# Altium schematic sheet FG23_diff_PA_match_SCH_RF_Power.SchDoc
size 420 x 297 mm
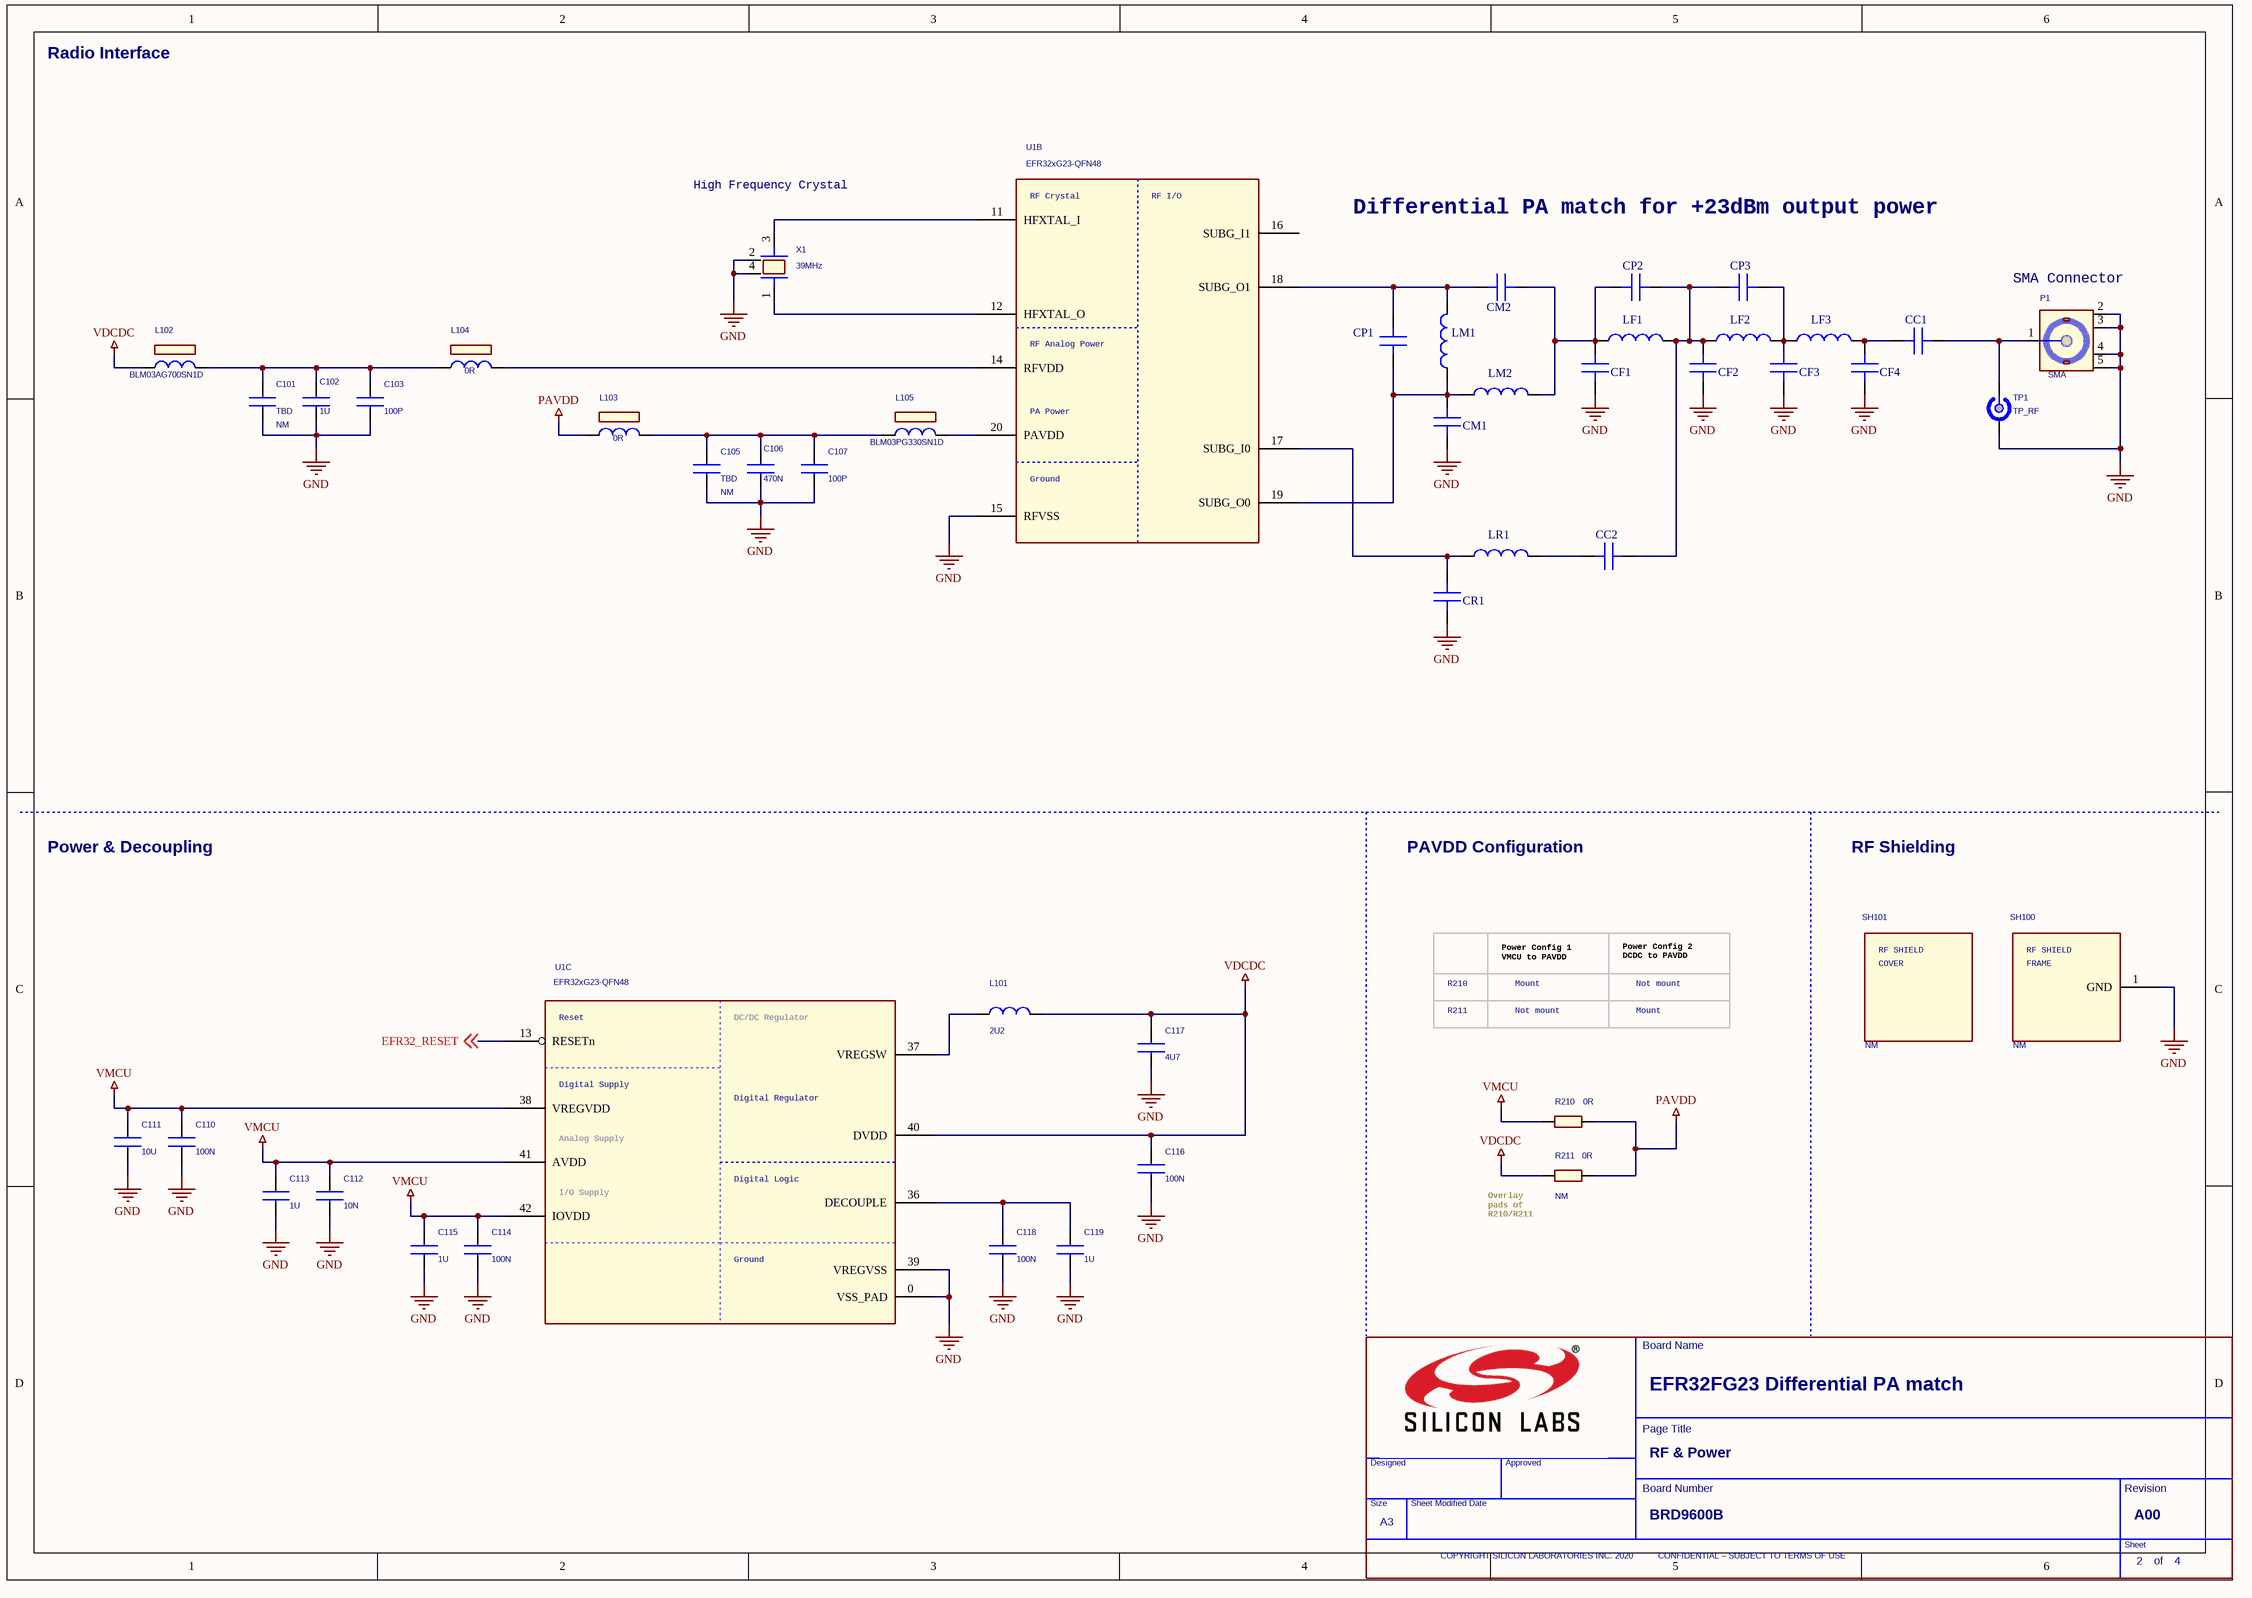
[diagram p0: FG23_diff_PA_match_SCH_RF_Power.SchDoc]

## Parts
*  Doc: BRD9600B  RevCode: A00  Page Title: RF & Power  Page Size: A3  Page Number: 2  Page Count: 4  Title: EFR32FG23 Differential PA match  (hidden comment: TitleBlock_SiliconLabs_A3)  (graphical)
C101  TBD  Not Mounted: NM  [C0201_L]
C102  1U  [C0402_L]
C103  100P  [C0201_L]
C105  TBD  Not Mounted: NM  [C0201_L]
C106  470N  [C0402_L]
C107  100P  [C0201_L]
C110  100N  [C0201_L]
C111  10U  [C0603_L]
C112  10N  [C0201_L]
C113  1U  [C0402_L]
C114  100N  [C0201_L]
C115  1U  [C0402_L]
C116  100N  [C0201_L]
C117  4U7  [C0603_L]
C118  100N  [C0201_L]
C119  1U  [C0402_L]
CC1  (no value)  [C0201_GM]
CC2  (no value)  [C0201_GM]
CF1  (no value)  [C0201_GM]
CF2  (no value)  [C0201_GM]
CF3  (no value)  [C0201_GM]
CF4  (no value)  [C0201_GM]
CM1  (no value)  [C0201_GM]
CM2  (no value)  [C0201_GM]
CP1  (no value)  [C0201_GM]
CP2  (no value)  [C0201_GM]
CP3  (no value)  [C0201_GM]
CR1  (no value)  [C0201_GM]
L101  2U2  [COIL_1008_L]
L102  BLM03AG700SN1D  [COIL_MUR_BLM03_0201]
L103  0R  [COIL_MUR_BLM03_0201]
L104  0R  [COIL_MUR_BLM03_0201]
L105  BLM03PG330SN1D  [COIL_MUR_BLM03_0201]
LF1  LQP03HQ3N6B02  [COIL_0201_GM]  (value not drawn)
LF2  LQP03HQ3N6B02  [COIL_0201_GM]  (value not drawn)
LF3  LQP03HQ3N6B02  [COIL_0201_GM]  (value not drawn)
LM1  LQP03HQ3N6B02  [COIL_0201_GM]  (value not drawn)
LM2  LQP03HQ3N6B02  [COIL_0201_GM]  (value not drawn)
LR1  LQP03HQ3N6B02  [COIL_0201_GM]  (value not drawn)
P1  SMA  [TE_SMA_1814832_TH_VER]
R210  0R  [R0402_L]
R211  0R  Not Mounted: NM  [R0402_L]
SH100  Not Mounted: NM  [Shield_21x21mm]  (hidden comment: RF_SHIELD_FRAME_36103205S)
SH101  Not Mounted: NM  (hidden comment: RF_SHIELD_COVER_36003200S)
TP1  TP_RF  [TP_INGUN_50OHM_PARTIAL]
U1  EFR32xG23-QFN48  [QFN48_M040_6.0X6.0_EP_SL]  (parts B,C of 3)
X1  39MHz  [X_SSS_DSX211SH_2.05X1.65-4]

## Nets
GND: C101.2 C102.2 C103.2 C105.2 C106.2 C107.2 C110.2 C111.2 C112.2 C113.2 C114.2 C115.2 C116.2 C117.2 C118.2 C119.2 CF1.1 CF2.1 CF3.1 CF4.1 CM1.1 CR1.1 P1.2(GND1) P1.3(GND2) P1.4(GND3) P1.5(GND4) SH100.1(GND) TP1.2(GND) U1.0(VSS_PAD) U1.15(RFVSS) U1.39(VREGVSS) X1.2 X1.4
PAVDD: L103.1 R210.1 R211.2
VDCDC: C116.1 C117.1 L101.2 L102.1 R211.1 U1.40(DVDD)
VMCU: C110.1 C111.1 C112.1 C113.1 C114.1 C115.1 R210.2 U1.38(VREGVDD) U1.41(AVDD) U1.42(IOVDD)
EFR32_RESET: U1.13(RESETn) ; off-sheet EFR32_RESET
NetC101_1: C101.1 C102.1 C103.1 L102.2 L104.1
NetC105_1: C105.1 C106.1 C107.1 L103.2 L105.1
NetC118_1: C118.1 C119.1 U1.36(DECOUPLE)
NetCC1_1: CC1.1 CF4.2 LF3.2
NetCC1_2: CC1.2 P1.1(SIGNAL) TP1.1(RF)
NetCC2_1: CC2.1 LR1.2
NetCC2_2: CC2.2 CF2.2 CP2.2 CP3.1 LF1.2 LF2.1
NetCF1_2: CF1.2 CM2.2 CP2.1 LF1.1 LM2.2
NetCF3_2: CF3.2 CP3.2 LF2.2 LF3.1
NetCM1_2: CM1.2 CP1.1 LM1.1 LM2.1 U1.19(SUBG_O0)
NetCM2_1: CM2.1 CP1.2 LM1.2 U1.18(SUBG_O1)
NetCR1_2: CR1.2 LR1.1 U1.17(SUBG_I0)
NetL101_1: L101.1 U1.37(VREGSW)
NetL104_2: L104.2 U1.14(RFVDD)
NetL105_2: L105.2 U1.20(PAVDD)
NetU1_11: U1.11(HFXTAL_I) X1.3
NetU1_12: U1.12(HFXTAL_O) X1.1

Not connected (* = marked no-connect by the designer): U1 16(SUBG_I1)

## Notes on the sheet
- Radio Interface
- High Frequency Crystal
- Differential PA match for +23dBm output power
- (near P1) SMA Connector
- Power & Decoupling
- PAVDD Configuration
- RF Shielding
- R210
- Power Config 1
  VMCU to PAVDD
- Mount
- Power Config 2
  DCDC to PAVDD
- Not mount
- R211
- (near R211) Overlay
  pads of
  R210/R211
- (in symbol EFR32xG23_QFN48, part B) RF Crystal; RF I/O; RF Analog Power; PA Power; Ground
- (in symbol EFR32xG23_QFN48, part C) Reset; DC/DC Regulator; Digital Supply; Digital Regulator; Analog Supply; Digital Logic; I/O Supply; Ground
- (in symbol RF_SHIELD_COVER_36003200S) RF SHIELD; COVER
- (in symbol RF_SHIELD_FRAME_36103205S) RF SHIELD; FRAME
- (in symbol TitleBlock_SiliconLabs_A3) Board Name; Page Title; Designed; Approved; Board Number; Revision; Size; Sheet Modified Date; Sheet; COPYRIGHT SILICON LABORATORIES INC. 2020          CONFIDENTIAL – SUBJECT TO TERMS OF USE; of

## Library data of the parts
C101 C105 = C0201: Tolerance: +/-0.05P; Rating: 50V; Technology: C0G
C102 C113 C115 C119 = C0402: Tolerance: 10%; Rating: 6.3V; Technology: X7R
C103 C107 = C0201: Tolerance: 5%; Rating: 25V; Technology: C0G
C106 = C0402: Tolerance: 10%; Rating: 10V; Technology: X7R
C110 C114 C116 C118 = C0201: Tolerance: 20%; Rating: 16V; Technology: X7S
C111 = C0603: Tolerance: 10%; Rating: 25V; Technology: X5R
C112 = C0201: Tolerance: 10%; Rating: 16V; Technology: X7S
C117 = C0603: Tolerance: 10%; Rating: 6.3V; Technology: X7R
CC1 CC2 = CMP-120-00593-A.01: CAP CER 0201 C0G 50V ±0.1pF; Manufacturer: Murata; Manufacturer PN: GJM0335C1H7R1BB01; Value: 220; SubCategory Tag: Ceramic; Min Operating Temp: -55°C; RoHS: Compliant; Material: C0G; Package: 0201; Tolerance: 0.1pF; Max Operating Temp: 125°C; Mount: SMD; Rating: 50V
CF1 CF4 = CMP-120-00593-A.01: CAP CER 0201 C0G 50V ±0.1pF; Manufacturer: Murata; Manufacturer PN: GJM0335C1H7R1BB01; Value: 15; SubCategory Tag: Ceramic; Min Operating Temp: -55°C; RoHS: Compliant; Material: C0G; Package: 0201; Tolerance: 0.1pF; Max Operating Temp: 125°C; Mount: SMD; Rating: 50V
CF2 CF3 = CMP-120-00593-A.01: CAP CER 0201 C0G 50V ±0.1pF; Manufacturer: Murata; Manufacturer PN: GJM0335C1H7R1BB01; Value: 30; SubCategory Tag: Ceramic; Min Operating Temp: -55°C; RoHS: Compliant; Material: C0G; Package: 0201; Tolerance: 0.1pF; Max Operating Temp: 125°C; Mount: SMD; Rating: 50V
CM1 = CMP-120-00593-A.01: CAP CER 0201 C0G 50V ±0.1pF; Manufacturer: Murata; Manufacturer PN: GJM0335C1H7R1BB01; Value: 82; SubCategory Tag: Ceramic; Min Operating Temp: -55°C; RoHS: Compliant; Material: C0G; Package: 0201; Tolerance: 0.1pF; Max Operating Temp: 125°C; Mount: SMD; Rating: 50V
CM2 = CMP-120-00593-A.01: CAP CER 0201 C0G 50V ±0.1pF; Manufacturer: Murata; Manufacturer PN: GJM0335C1H7R1BB01; Value: 43; SubCategory Tag: Ceramic; Min Operating Temp: -55°C; RoHS: Compliant; Material: C0G; Package: 0201; Tolerance: 0.1pF; Max Operating Temp: 125°C; Mount: SMD; Rating: 50V
CP1 = CMP-120-00593-A.01: CAP CER 0201 C0G 50V ±0.1pF; Manufacturer: Murata; Manufacturer PN: GJM0335C1H7R1BB01; Value: 27; SubCategory Tag: Ceramic; Min Operating Temp: -55°C; RoHS: Compliant; Material: C0G; Package: 0201; Tolerance: 0.1pF; Max Operating Temp: 125°C; Mount: SMD; Rating: 50V
CP2 CP3 = CMP-120-00593-A.01: CAP CER 0201 C0G 50V ±0.1pF; Manufacturer: Murata; Manufacturer PN: GJM0335C1H7R1BB01; Value: N.M.; SubCategory Tag: Ceramic; Min Operating Temp: -55°C; RoHS: Compliant; Material: C0G; Package: 0201; Tolerance: 0.1pF; Max Operating Temp: 125°C; Mount: SMD; Rating: 50V
CR1 = CMP-120-00593-A.01: CAP CER 0201 C0G 50V ±0.1pF; Manufacturer: Murata; Manufacturer PN: GJM0335C1H7R1BB01; Value: 2.6; SubCategory Tag: Ceramic; Min Operating Temp: -55°C; RoHS: Compliant; Material: C0G; Package: 0201; Tolerance: 0.1pF; Max Operating Temp: 125°C; Mount: SMD; Rating: 50V
L101 = L1008: Tolerance: +/-20%; Mfg #: DFE2HCAH2R2MJ0L; Mfg: Murata
L102 L105 = BLM03AX: Mfg: Murata; Price_1K: 0.05
  L102: Mfg #: BLM03AG700SN1D
  L105: Mfg #: BLM03PG330SN1D
L103 L104 = BLM03AX: Price_1K: 0.05
LF1 LF2 = CMP-155-00127-A.01: IND Fixed 0201 500mA 170mOhm ±0.1nH; Manufacturer: Murata; Value: 56; Shielding: Not shielded; DC Resistance: 0.17; Min Operating Temp: -55°C; Max Operating Temp: 125°C; Manufacturer PN: LQP03HQ3N6B02; RoHS: Compliant; SubCategory Tag: Fixed; Mount: SMD; Package: 0201; Tolerance: 0.1nH; Rating: 500mA
LF3 = CMP-155-00127-A.01: IND Fixed 0201 500mA 170mOhm ±0.1nH; Manufacturer: Murata; Value: 43; Shielding: Not shielded; DC Resistance: 0.17; Min Operating Temp: -55°C; Max Operating Temp: 125°C; Manufacturer PN: LQP03HQ3N6B02; RoHS: Compliant; SubCategory Tag: Fixed; Mount: SMD; Package: 0201; Tolerance: 0.1nH; Rating: 500mA
LM1 = CMP-155-00127-A.01: IND Fixed 0201 500mA 170mOhm ±0.1nH; Manufacturer: Murata; Value: 36; Shielding: Not shielded; DC Resistance: 0.17; Min Operating Temp: -55°C; Max Operating Temp: 125°C; Manufacturer PN: LQP03HQ3N6B02; RoHS: Compliant; SubCategory Tag: Fixed; Mount: SMD; Package: 0201; Tolerance: 0.1nH; Rating: 500mA
LM2 = CMP-155-00127-A.01: IND Fixed 0201 500mA 170mOhm ±0.1nH; Manufacturer: Murata; Value: 20; Shielding: Not shielded; DC Resistance: 0.17; Min Operating Temp: -55°C; Max Operating Temp: 125°C; Manufacturer PN: LQP03HQ3N6B02; RoHS: Compliant; SubCategory Tag: Fixed; Mount: SMD; Package: 0201; Tolerance: 0.1nH; Rating: 500mA
LR1 = CMP-155-00127-A.01: IND Fixed 0201 500mA 170mOhm ±0.1nH; Manufacturer: Murata; Value: 220; Shielding: Not shielded; DC Resistance: 0.17; Min Operating Temp: -55°C; Max Operating Temp: 125°C; Manufacturer PN: LQP03HQ3N6B02; RoHS: Compliant; SubCategory Tag: Fixed; Mount: SMD; Package: 0201; Tolerance: 0.1nH; Rating: 500mA
P1 = SMA_TH_WELLSHOW: Mfg #: C02AN31P00101; Price_1K: 1.46; Mfg: Wellshow
R210 R211 = R0402: Price_1K: 0.005
SH100 = RF_SHIELD_FRAME_36103205S: Mfg: Würth Elektronik; Mfg #: 36103205S; Price_1k: 1.00
SH101 = RF_SHIELD_COVER_36003200S: Mfg: Würth Elektronik; Mfg #: 36003200S; Price_1k: 0.944
U1 = EFR32xG23_QFN48: MFG: Silicon Labs; MFG #: EFR32xG23-QFN48
X1 = DSX211SH: Mfg #: TBD; Price_1K: 0.512; Mfg: TBD
* = TitleBlock_SiliconLabs_A3: OrgName: Silicon Labs